# Altium schematic sheet powersupply.SchDoc
size A4; SheetNumber: 5; SheetTotal: 5
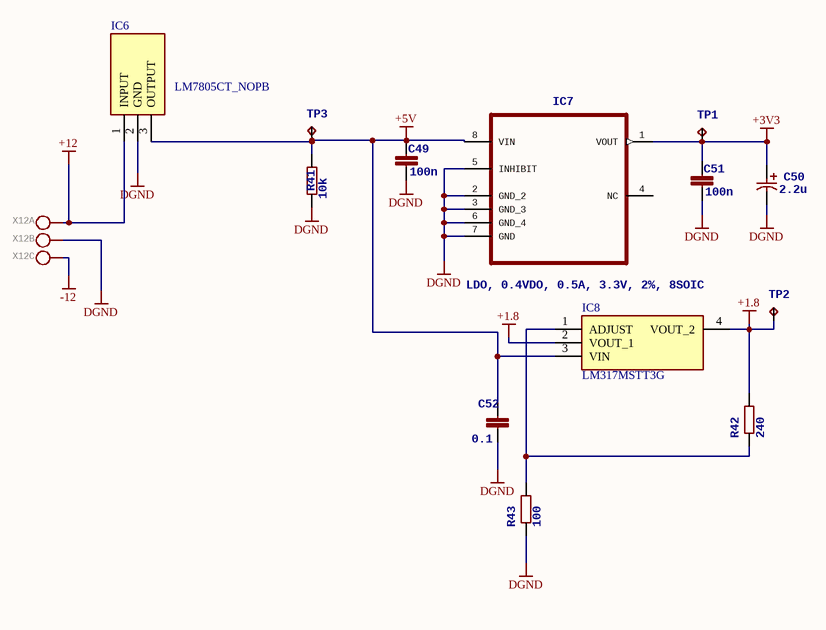
[diagram p0: powersupply.SchDoc]

## Parts
C49  100n  [C0603]
C50  2.2u  [CAPAE430X610N]
C51  100n  [C0603]
C52  0.1  [C0603]
IC6  LM7805CT_NOPB  [TO254P470X1028X1955-3P]
IC7  LDO, 0.4VDO, 0.5A, 3.3V, 2%, 8SOIC  [SOIC127P600X175-8N]
IC8  LM317MSTT3G  [SOT230P700X175-4N]
R41  10k  [R0805]
R42  240  [R1206]
R43  100  [R1206]
TP1  TPB2,54  [B2,54]  (value not drawn)
TP2  TPB2,54  [B2,54]  (value not drawn)
TP3  TPB2,54  [B2,54]  (value not drawn)
X12  (no value)  [W237-103]  (parts A,B,C of 3)

## Nets
+1.8: IC8.2(VOUT_1) IC8.4(VOUT_2) R42.2 TP2.TP
+3V3: C50.1 C51.1 IC7.1(VOUT) TP1.TP
+5V: C49.1 C52.2 IC6.3(OUTPUT) IC7.8(VIN) IC8.3(VIN) R41.2 TP3.TP
+12: IC6.1(INPUT) X12.1(KL)
-12: X12.3(KL)
DGND: C49.2 C50.2 C51.2 C52.1 IC6.2(GND) IC7.2(GND_2) IC7.3(GND_3) IC7.5(INHIBIT) IC7.6(GND_4) IC7.7(GND) R41.1 R43.1 X12.2(KL)
NetIC8_1: IC8.1(ADJUST) R42.1 R43.2

Not connected (* = marked no-connect by the designer): IC7 4(NC)

## Library data of the parts
C49 C51 = C-EUC0603: <B>CAPACITOR</B>, European symbol; SPICEPREFIX: C
C50 = EEE--CASE-B: MPN: EEE-FT0J101AR; MPN: EEE-FT1A680AR; MPN: EEE-FT1C470AR; MPN: EEE-FT1E220AR; MPN: EEE-FT1E330AR; MPN: EEE-FT1V220AR; MPN: EEE-FTH100UAR; MPN: EEE-HA0J220R; MPN: EEE-HA0J330WR; MPN: EEE-HA0J470WR; MPN: EEE-HA1A220WR; MPN: EEE-HA1A330WR; MPN: EEE-HA1C100R; MPN: EEE-HA1C220WR; MPN: EEE-HA1E100WR; MPN: EEE-HA1E4R7R; MPN: EEE-HA1H1R0R; MPN: EEE-HA1H2R2R; MPN: EEE-HA1H3R3R; MPN: EEE-HA1HR10R; MPN: EEE-HA1HR22R; MPN: EEE-HA1HR33R; MPN: EEE-HA1HR47R; MPN: EEE-HA1V100WR; MPN: EEE-HA1V4R7R; MPN: EEE-HB0J220R; MPN: EEE-HB1C100R; MPN: EEE-HB1E4R7R; MPN: EEE-HB1H1R0R; MPN: EEE-HB1H2R2R; MPN: EEE-HC0J220R; MPN: EEE-HC1C100R; MPN: EEE-HC1H1R0R; MPN: EEE-HC1H2R2R; MPN: EEE-HC1H3R3R; MPN: EEE-HC1HR10R; MPN: EEE-HC1HR33R; MPN: EEE-HC1HR47R; TOLERANCE: ±20 %; VOLTAGERATING: 6.3V; VOLTAGERATING: 10V; VOLTAGERATING: 16V; VOLTAGERATING: 25V; VOLTAGERATING: 35V; VOLTAGERATING: 50V; OC_FARNELL: 2065951; OC_NEWARK: 73T9146; PACKAGE: CASE-B; SUPPLIER: PANASONIC; OC_FARNELL: 2065959; OC_NEWARK: 73T9155; OC_FARNELL: 2065967; OC_NEWARK: 73T9160; OC_FARNELL: 1868402; OC_NEWARK: 31T8175; OC_FARNELL: 1868403; OC_NEWARK: 53W8320; OC_FARNELL: 1868413; OC_NEWARK: 31T8187; OC_FARNELL: 1868422; OC_NEWARK: 31T8171; OC_FARNELL: 1973274; OC_NEWARK: 58T9198; OC_FARNELL: 1973275; OC_NEWARK: 58T9199; OC_FARNELL: 1973276; OC_NEWARK: 58T9204; OC_FARNELL: 1973288; OC_NEWARK: 58T9209; OC_FARNELL: 1973291; OC_NEWARK: 58T9213; OC_FARNELL: 1973301; OC_NEWARK: 58T9217; OC_FARNELL: 1973302; OC_NEWARK: 58T9220; OC_FARNELL: 1973318; OC_NEWARK: 58T9233; OC_FARNELL: 1973317; OC_NEWARK: 58T9245; OC_FARNELL: 1973358; OC_NEWARK: 58T9253; OC_FARNELL: 1973359; OC_NEWARK: 58T9257; OC_FARNELL: 1973360; OC_NEWARK: 58T9260; OC_FARNELL: 1973353; OC_NEWARK: 58T9249; OC_FARNELL: 1973354; OC_NEWARK: 58T9250; OC_FARNELL: 1973355; OC_NEWARK: 58T9251; OC_FARNELL: 1973357; OC_NEWARK: unknown; OC_FARNELL: 1973338; OC_NEWARK: 58T9275; OC_FARNELL: 1973337; OC_NEWARK: 58T9286; OC_FARNELL: 9696750; OC_NEWARK: 96K9411; OC_FARNELL: 9696792; OC_NEWARK: 96K9414; OC_FARNELL: 9696822; OC_NEWARK: 96K9418; OC_FARNELL: 9696857; OC_NEWARK: 96K9419; OC_FARNELL: 9696865; OC_NEWARK: 96K9421; OC_FARNELL: 1714683; OC_NEWARK: 15R0902; OC_FARNELL: 1714692; OC_NEWARK: 15R0908; OC_FARNELL: 1714712; OC_NEWARK: 15R0921; OC_FARNELL: 1714713; OC_NEWARK: 15R0924; OC_FARNELL: 1714714; OC_NEWARK: 15R0926; OC_FARNELL: 1714708; OC_NEWARK: 15R0917; OC_FARNELL: 1714710; OC_NEWARK: 15R0919; OC_FARNELL: 1714711; OC_NEWARK: 15R0920
C52 = C-EUC0603: SPICEPREFIX: C
IC6 = LM7805CT_NOPB: Integrated Circuit; Manufacturer_Name: Texas Instruments; Manufacturer_Part_Number: LM7805CT/NOPB; Datasheet Link: http://www.ti.com/lit/gpn/lm7800; Height: 4.7mm; Mouser Part Number: 926-LM7805CT/NOPB; Mouser Price/Stock: https://www.mouser.co.uk/ProductDetail/Texas-Instruments/LM7805CT-NOPB?qs=OYMYEaN9QmBS2GvaX6GSkQ%3D%3D; Arrow Part Number: LM7805CT/NOPB; Arrow Price/Stock: https://www.arrow.com/en/products/lm7805ctnopb/texas-instruments.html?utm_currency=USD&region=asia
IC7 = KF33BD-TR: MPN: KF33BD-TR; OC_FARNELL: 2253497; OC_NEWARK: 25M9948; PACKAGE: SOIC-8; SUPPLIER: STMicroelectronics
IC8 = LM317MSTT3G: Internal Short Circuit Current Limiting; Internal Thermal Overload Protection; Output Current in Excess of 500 mA; Output Transistor Safe-Area Compensation; Output Adjustable between 1.2 V and 37 V; Floating Operation for High Voltage Applications; Eliminates Stocking Many Fixed Voltages; Pb-Free Packages are Available; NCV Prefix for Automotive and Other Applications Requiring Site Control Changes; Manufacturer_Name: onsemi; Geometry.Height: 1.75mm; Mouser Part Number: 863-LM317MSTT3G; Mouser Price/Stock: https://www.mouser.co.uk/ProductDetail/onsemi/LM317MSTT3G?qs=2OtswVQKCOFpDo6oeYvGzw%3D%3D; Manufacturer_Part_Number: LM317MSTT3G; Datasheet Link: https://www.onsemi.com/pub/Collateral/LM317M-D.PDF
R41 = R-EU_R0805: <B>RESISTOR</B>, European symbol
R42 R43 = R-EU_R1206: SPICEPREFIX: R
TP1-TP3 = TPB2,54: <b>Test pad</b>
X12 = W237-103: GateName_1: -1; SymbolName_1: KL; GateName_2: -2; GateName_3: -3; SymbolName_3: KL+V; SymbolName_2: KL; LibraryName: con-wago-500; DeviceSetName: W237-103; Package: W237-103; MPN: 237-103; OC_FARNELL: unknown; OC_NEWARK: 18M7116